# EasyEDA Pro project 电刺激_两块板_2026-10-19.epro, schematic Schematic1

## Sheets
1 主控: Assembly Variant: Basic; Board Name: Board1; Create Date: 2026-04-27; Page Name: P1; Project Name: 电刺激+主控; Schematic Name: Schematic1; Update Date: 2026-04-27; Company: 嘉立创EDA; Page Size: A4; Version: V1.0
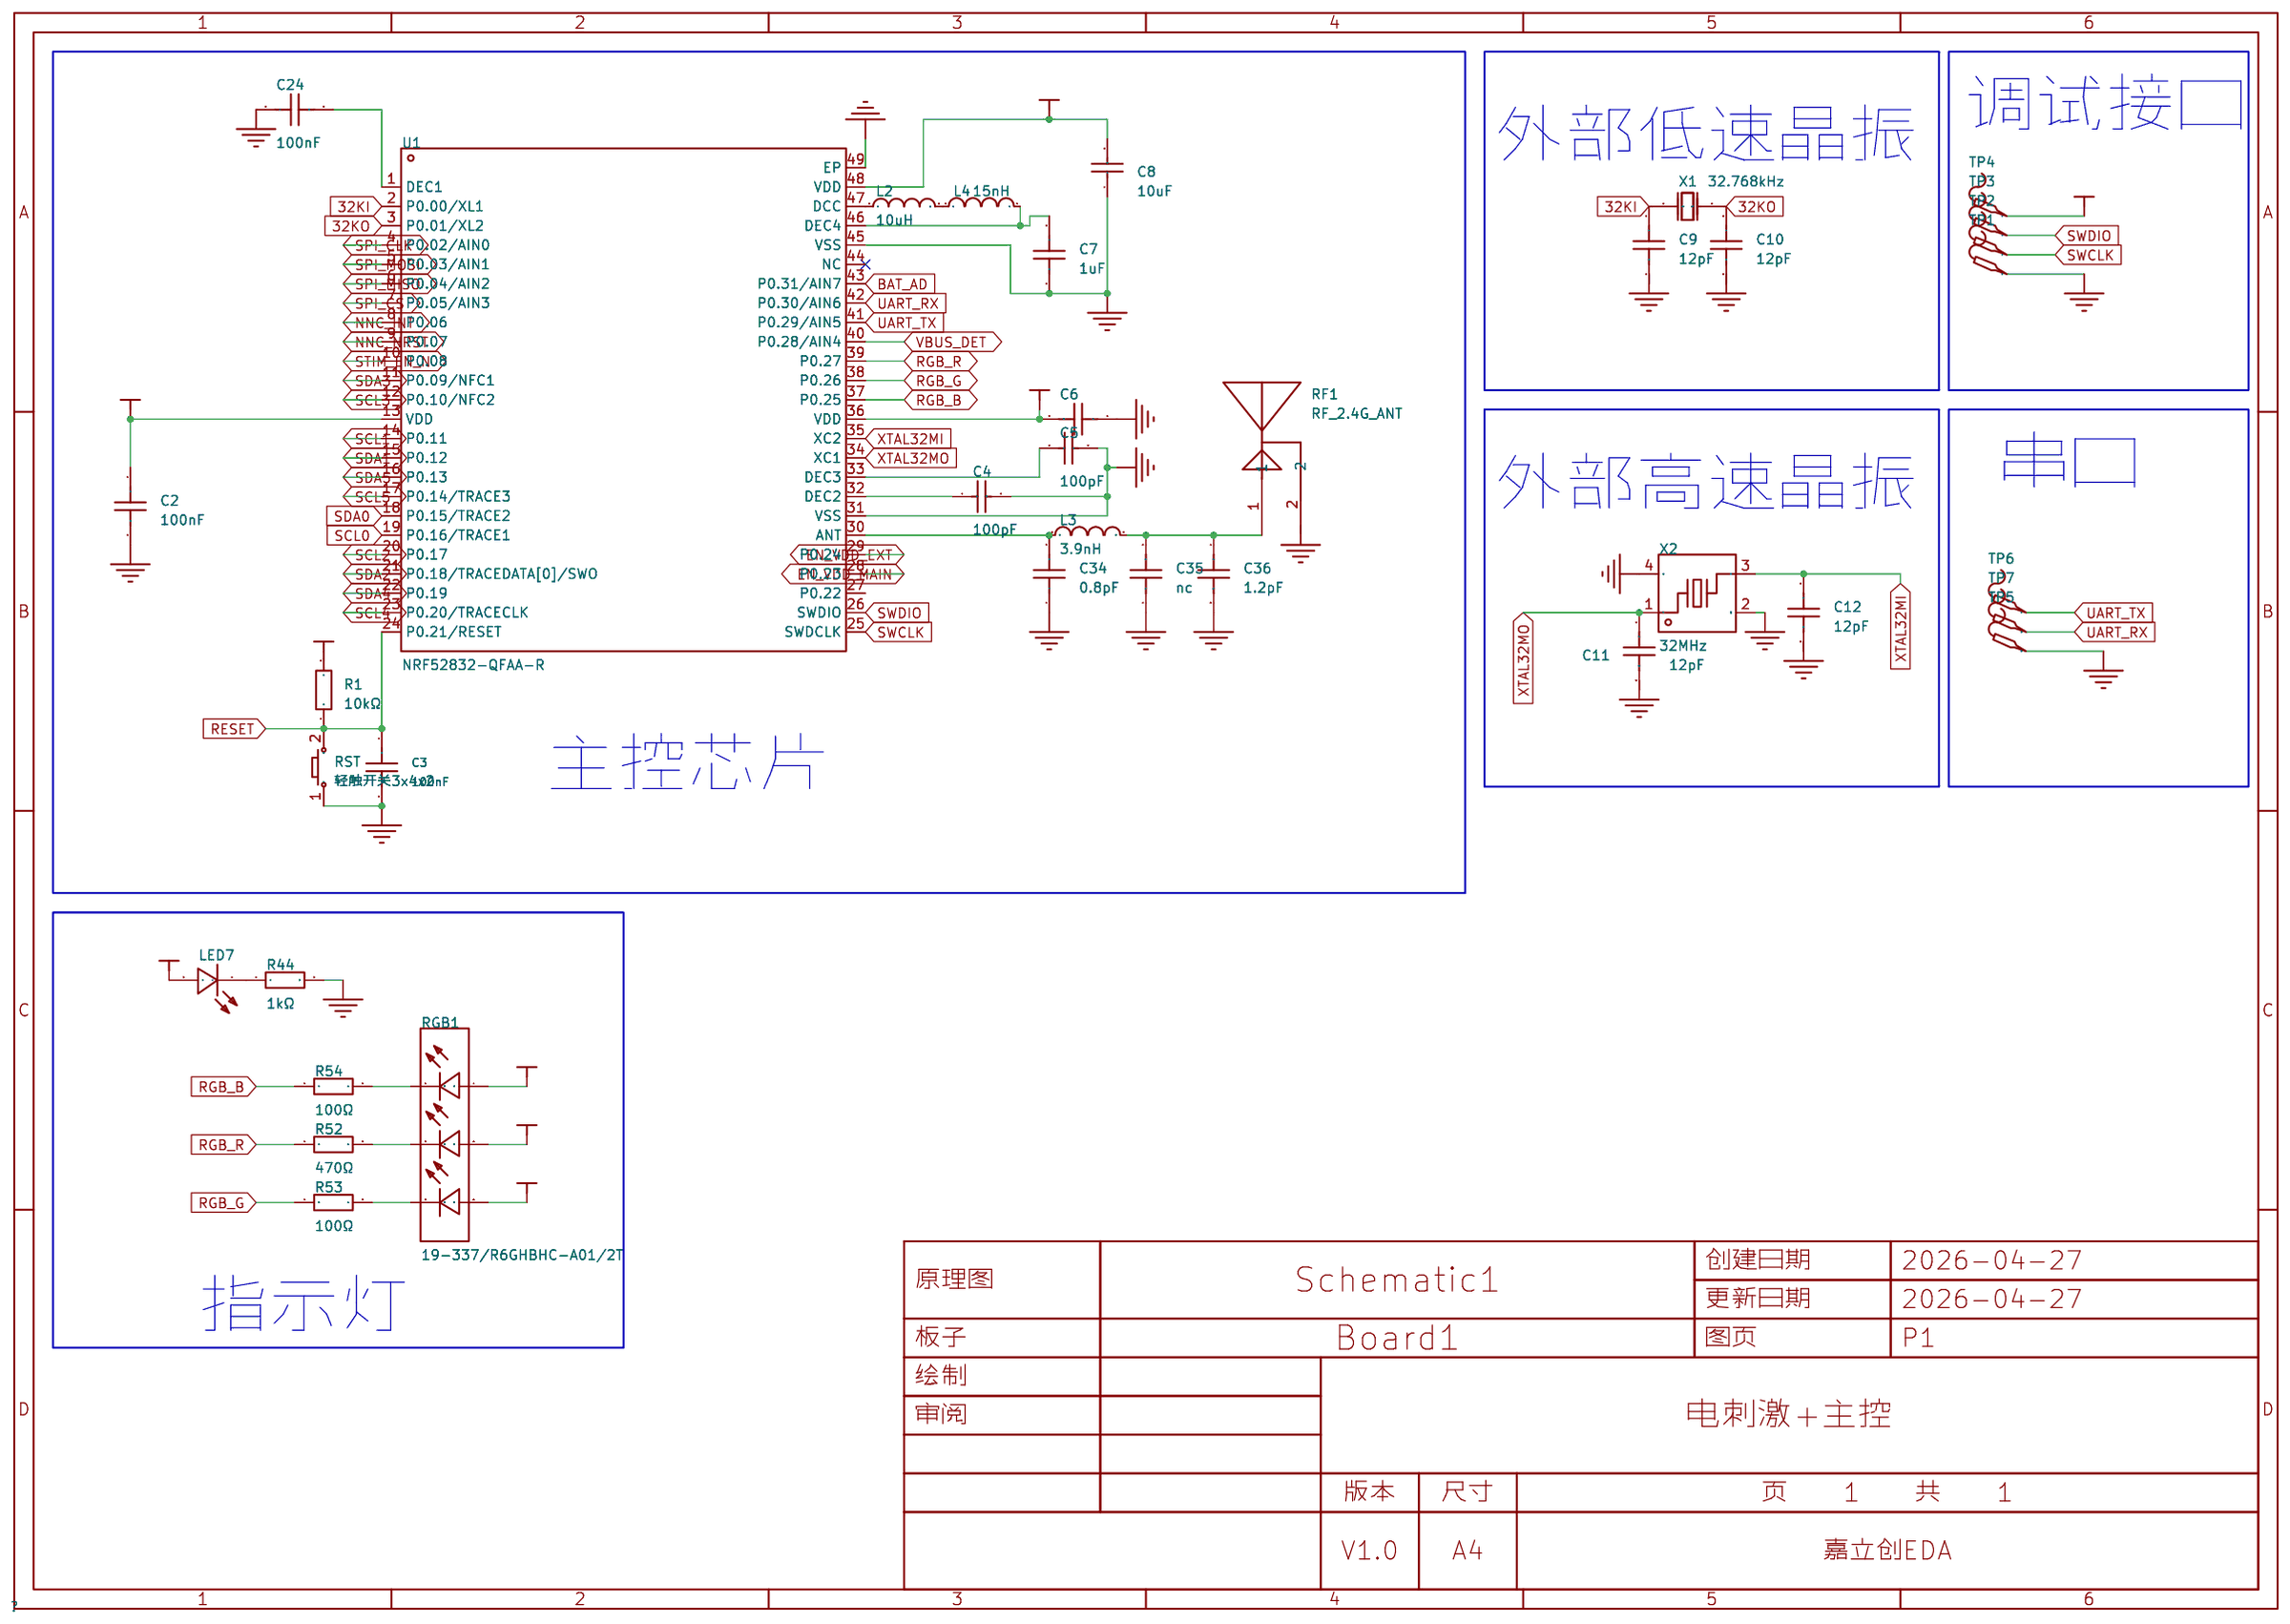
[diagram p2: 主控]
2 电源: Board Name: 主控板; Create Date: 2026-09-04; Project Name: 电刺激_两块板; Update Date: 2026-09-04
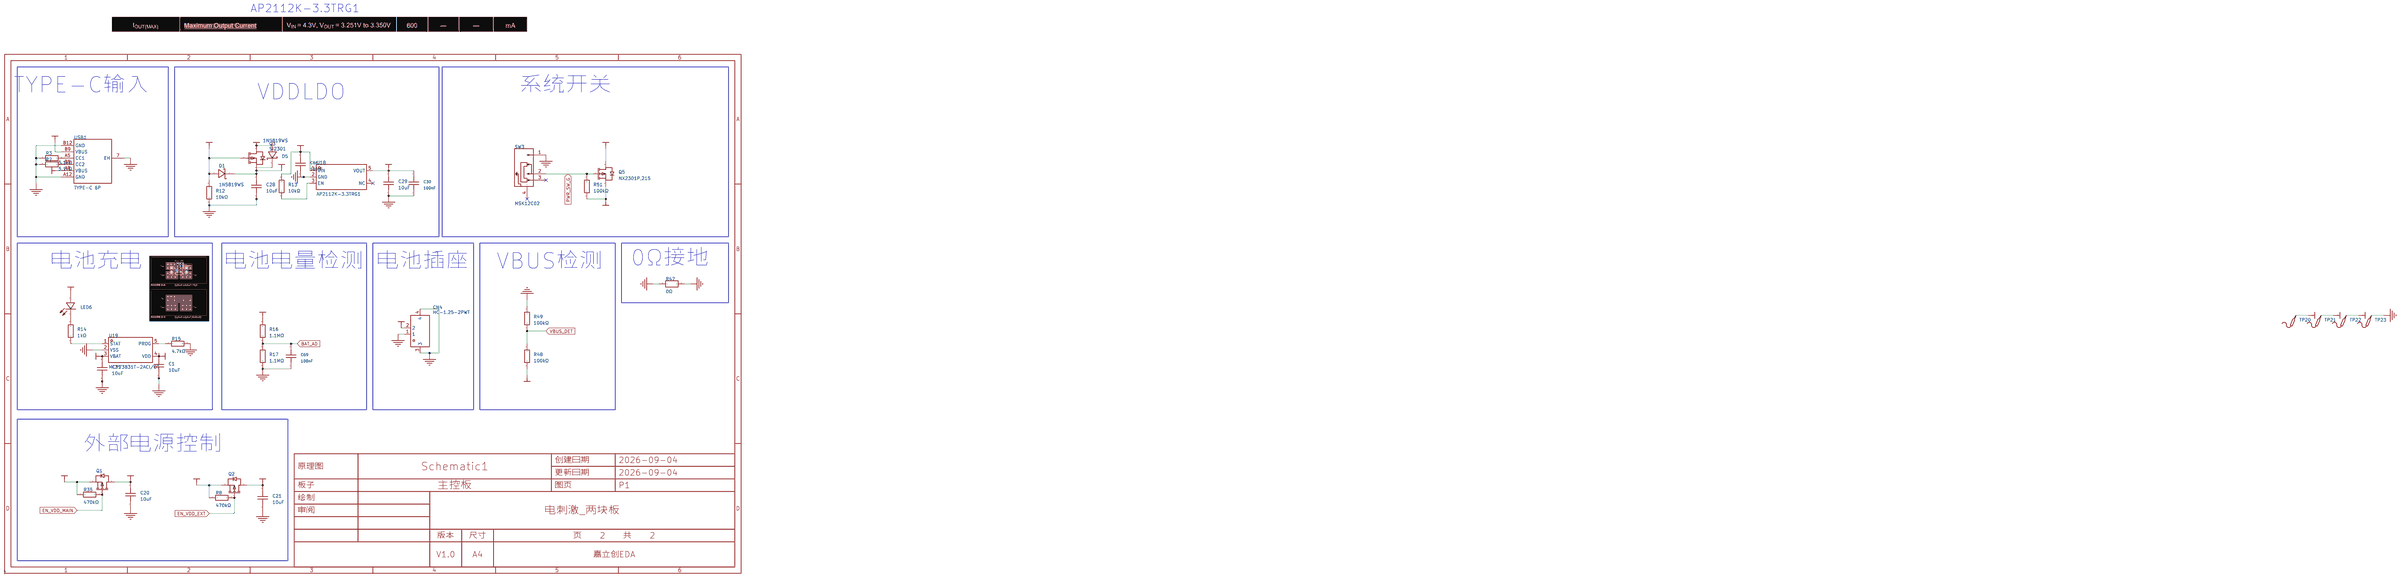
[diagram p3: 电源]
3 传感器与接口: Board Name: 主控板; Create Date: 2026-10-17; Project Name: 电刺激_两块板; Update Date: 2026-10-17
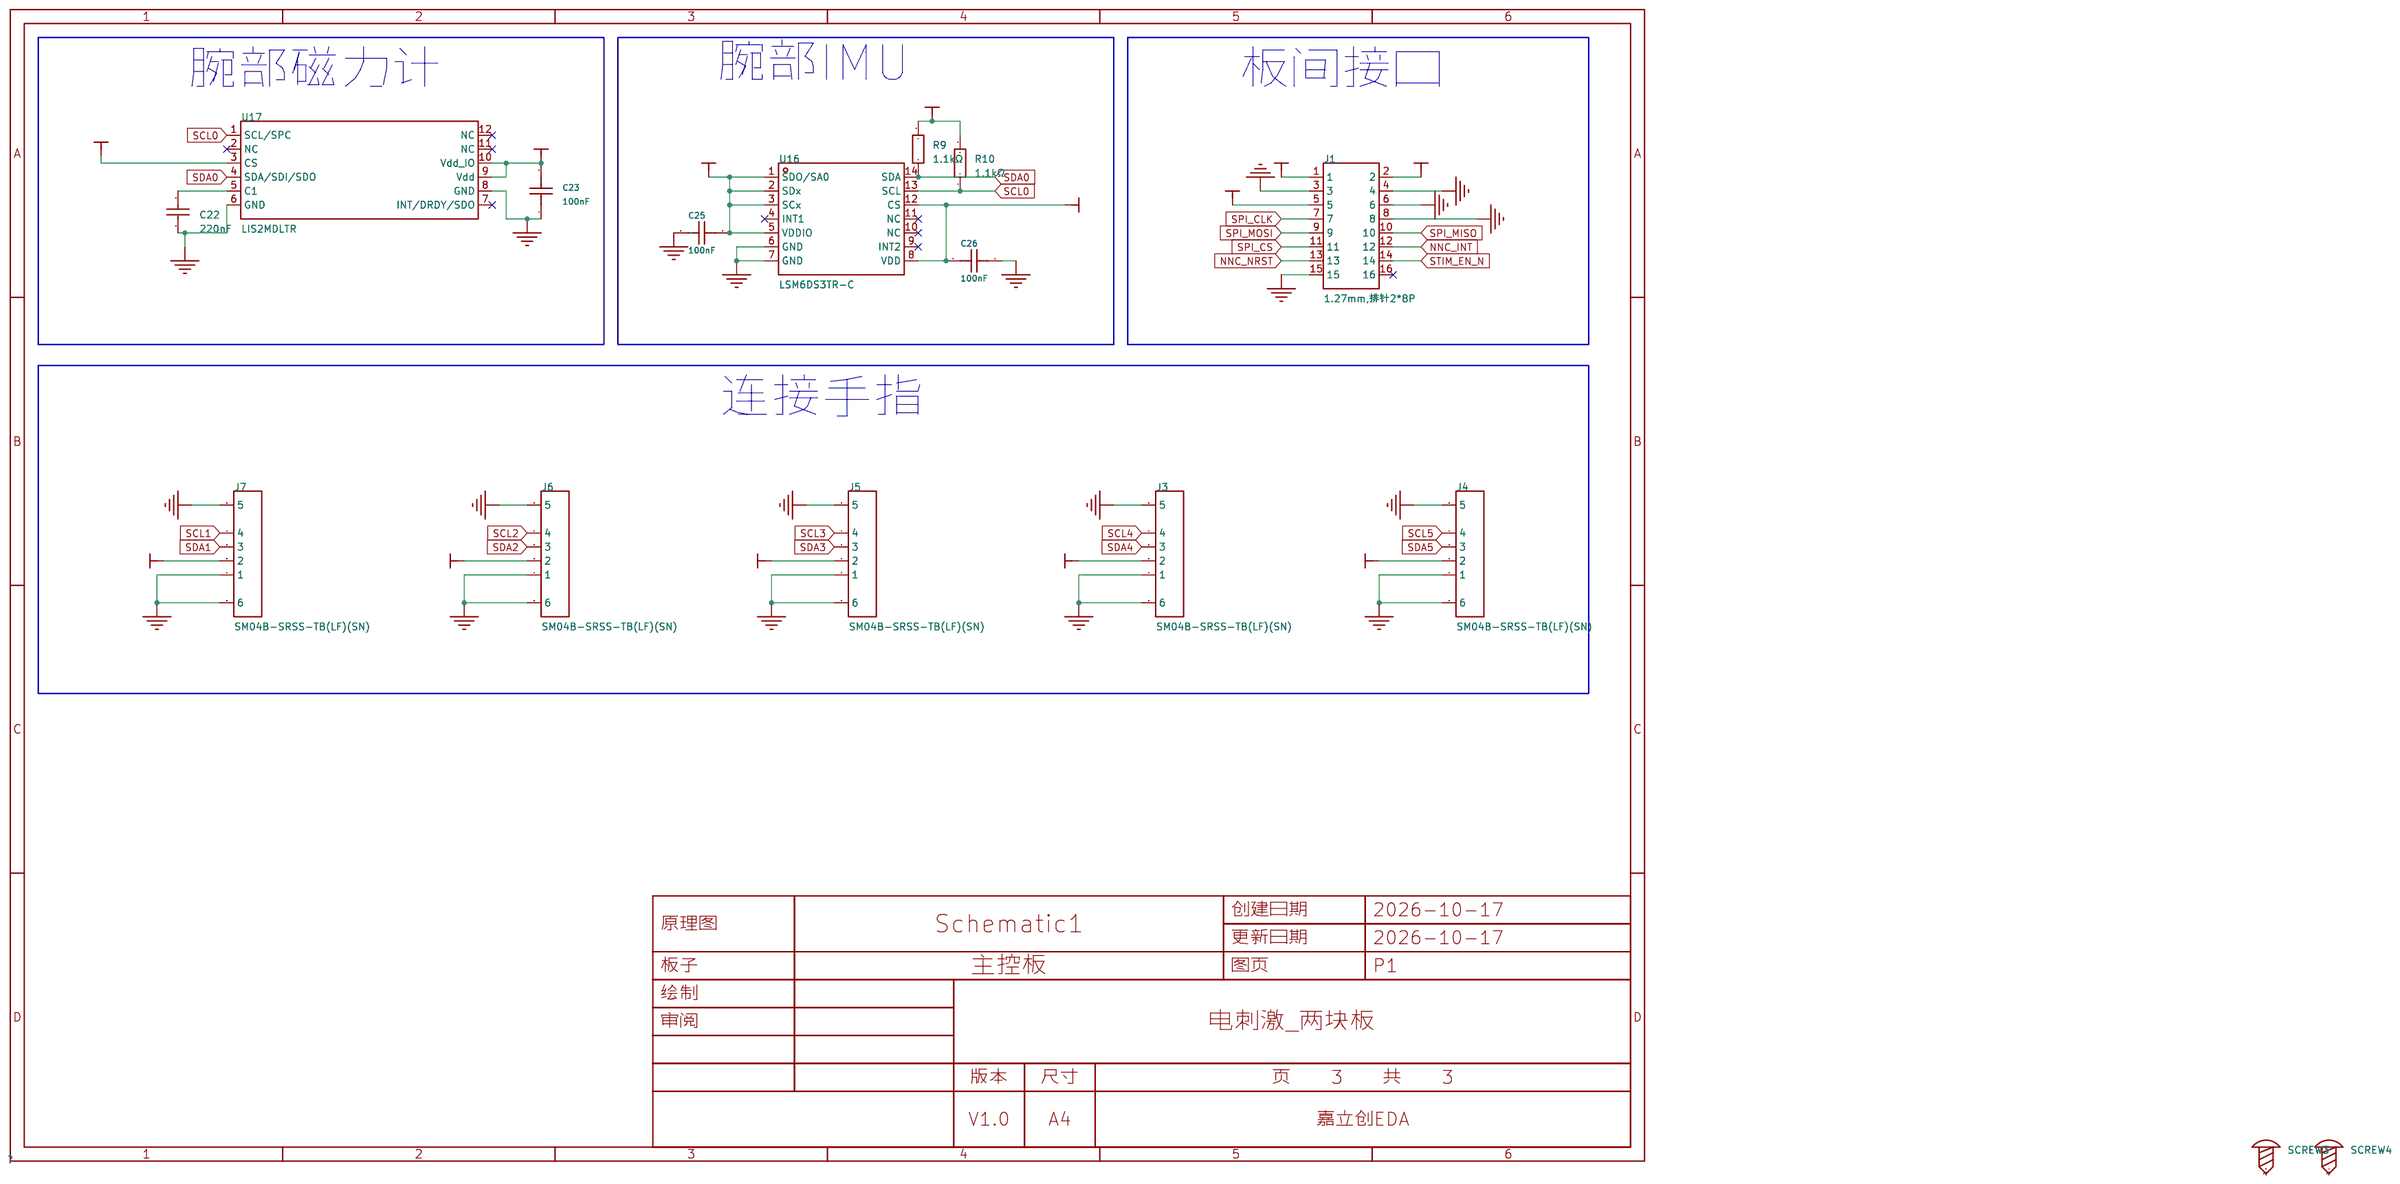
[diagram p4: 传感器与接口]

## Parts
sheet 主控
C2  100nF  [C0402]
C3  100nF  [C0603]
C4  100pF  [C0402]  (no BOM)
C5  100pF  [C0402]
C6  100nF  [C0402]
C7  1uF  [C0402]
C8  10uF  [C0402]
C9  12pF  [C0402]
C10  12pF  [C0402]
C11  12pF  [C0402]
C12  12pF  [C0402]
C24  100nF  [C0402]
C34  0.8pF  [C0402]
C35  nc  [C0402]  (no BOM)
C36  1.2pF  [C0402]
L2  10uH  [IND-SMD_L1.0-W0.5-2]
L3  3.9nH  [L0402]
L4  15nH  [IND-SMD_L1.0-W0.5-2]
LED7  NCD0402R1  [LED-SMD_L1.0-W0.5_FC-F1005UGK]
R1  10kΩ  [R0603]
R44  1kΩ  [R0603]
R52  470Ω  [R0603]
R53  100Ω  [R0603]
R54  100Ω  [R0603]
RF1  RF_2.4G_ANT  [天线封装]  (no BOM)
RGB1  19-337/R6GHBHC-A01/2T  [LED-ARRAY-SMD_6P-L1.6-W1.6-TL]
RST  轻触开关3x4x2  [Key_SMD_3x4x2]
TP1  -  [Test-Point-0.5mm]  (no BOM)
TP2  -  [Test-Point-0.5mm]  (no BOM)
TP3  -  [Test-Point-0.5mm]  (no BOM)
TP4  -  [Test-Point-0.5mm]  (no BOM)
TP5  -  [Test-Point-0.5mm]  (no BOM)
TP6  -  [Test-Point-0.5mm]  (no BOM)
TP7  -  [Test-Point-0.5mm]  (no BOM)
U1  NRF52832-QFAA-R  [QFN-48_L6.0-W6.0-P0.40-BL-EP3.8]
X1  32.768kHz  [OSC-SMD_2P-L3.2-W1.5]
X2  32MHz  [CRYSTAL-SMD_4P-L2.5-W2.0-BL]
sheet 传感器与接口
C22  220nF  [C0603]
C23  100nF  [C0603]
C25  100nF  [C0603]
C26  100nF  [C0603]
J1  1.27mm,排针2*8P  [HDR-SMD_16P-P1.27-V-M-R2-C8-LS5.3]
J3  SM04B-SRSS-TB(LF)(SN)  [CONN-SMD_4P-P1.00_SM04B-SRSS-TB-LF-SN]
J4  SM04B-SRSS-TB(LF)(SN)  [CONN-SMD_4P-P1.00_SM04B-SRSS-TB-LF-SN]
J5  SM04B-SRSS-TB(LF)(SN)  [CONN-SMD_4P-P1.00_SM04B-SRSS-TB-LF-SN]
J6  SM04B-SRSS-TB(LF)(SN)  [CONN-SMD_4P-P1.00_SM04B-SRSS-TB-LF-SN]
J7  SM04B-SRSS-TB(LF)(SN)  [CONN-SMD_4P-P1.00_SM04B-SRSS-TB-LF-SN]
R9  1.1kΩ  [R0603]
R10  1.1kΩ  [R0603]
SCREW3  -  [M2螺丝]  (no BOM)
SCREW4  -  [M2螺丝]  (no BOM)
U16  LSM6DS3TR-C  [LGA-14_L3.0-W2.5-P0.50-TL]
U17  LIS2MDLTR  [VLGA-12_L2.0-W2.0-P0.50-BL]
sheet 电源
C1  10uF  [C0603]
C20  10uF  [C0603]
C21  10uF  [C0603]
C28  10uF  [C0603]
C29  10uF  [C0603]
C30  100nF  [C0603]
C31  10uF  [C0603]
C66  100nF  [C0603]
C69  100nF  [C0603]
CN4  HC-1.25-2PWT  [CONN-SMD_2P-P1.25-HC-1.25-2PWT]
D1  1N5819WS  [SOD-323_L1.8-W1.3-LS2.5-RD]
D5  1N5819WS  [SOD-323_L1.8-W1.3-LS2.5-RD]
LED6  NCD0402R1  [LED-SMD_L1.0-W0.5_FC-F1005UGK]
Q1  NX2301P,215  [SOT-23-3_L2.9-W1.3-P1.90-LS2.4-BR]
Q2  NX2301P,215  [SOT-23-3_L2.9-W1.3-P1.90-LS2.4-BR]
Q3  SI2301  [SOT-23-3_L2.9-W1.3-P1.90-LS2.4-BR]
Q5  NX2301P,215  [SOT-23-3_L2.9-W1.3-P1.90-LS2.4-BR]
R2  5.1kΩ  [R0603]
R3  5.1kΩ  [R0603]
R8  470kΩ  [R0603]
R12  10kΩ  [R0603]
R13  10kΩ  [R0603]
R14  1kΩ  [R0603]
R15  4.7kΩ  [R0603]
R16  1.1MΩ  [R0603]
R17  1.1MΩ  [R0603]
R35  470kΩ  [R0603]
R47  0Ω  [R0805]
R48  100kΩ  [R0603]
R49  100kΩ  [R0603]
R51  100kΩ  [R0603]
SW3  MSK12C02  [SW-TH_MSK12C02]
TP20  -  [Test-Point-0.5mm]  (no BOM)
TP21  -  [Test-Point-0.5mm]  (no BOM)
TP22  -  [Test-Point-0.5mm]  (no BOM)
TP23  -  [Test-Point-0.5mm]  (no BOM)
U18  AP2112K-3.3TRG1  [SOT-25-5_L2.9-W1.6-P0.95-LS2.8-BL]
U19  MCP73831T-2ACI/OT  [SOT-23-5_L3.0-W1.7-P0.95-LS2.8-BL]
USB1  TYPE-C 6P  [TYPE-C-SMD_TYPE-C-6P_1]

## Library data of the parts
C2 C6 C24 = CL05B104KB54PNC: 容值:100nF;精度:±10%;额定电压:50V;温度系数:X7R;; LCSC Part Name: 100nF ±10% 50V; Supplier Part: C307331; Manufacturer: SAMSUNG(三星); Supplier Footprint: 0402; JLCPCB Part Class: Basic Part; Datasheet: https://item.szlcsc.com/datasheet/CL05B104KB54PNC/291005.html; Supplier: LCSC; Tolerance: ±10%; Voltage Rating: 50V; Temperature Coefficient: X7R
C3 C23 C25 C26 C30 C66 C69 = CC0603KRX7R9BB104: 容值:100nF;精度:±10%;额定电压:50V;温度系数:X7R;; LCSC Part Name: 100nF ±10% 50V; Supplier Part: C14663; Manufacturer: YAGEO(国巨); Supplier Footprint: 0603; JLCPCB Part Class: Basic Part; Datasheet: https://item.szlcsc.com/datasheet/CC0603KRX7R9BB104/15331.html; Supplier: LCSC; Tolerance: ±10%; Voltage Rating: 50V; Temperature Coefficient: X7R
C4 C5 = CL05C101JB5NNNC: 容值:100pF;精度:±5%;额定电压:50V;温度系数:C0G;; LCSC Part Name: 100pF ±5% 50V; Supplier Part: C26409; Manufacturer: SAMSUNG(三星); Supplier Footprint: 0402; JLCPCB Part Class: Extended Part; Datasheet: https://item.szlcsc.com/datasheet/CL05C101JB5NNNC/27153.html; Supplier: LCSC; Tolerance: ±5%; Voltage Rating: 50V; Temperature Coefficient: C0G
C7 = CL05A105KA5NQNC: 容值:1uF;精度:±10%;额定电压:25V;温度系数:X5R;; LCSC Part Name: 1uF ±10% 25V; Supplier Part: C52923; Manufacturer: SAMSUNG(三星); Supplier Footprint: 0402; JLCPCB Part Class: Basic Part; Datasheet: https://item.szlcsc.com/datasheet/CL05A105KA5NQNC/53938.html; Supplier: LCSC; Tolerance: ±10%; Voltage Rating: 25V; Temperature Coefficient: X5R
C8 = CL05A106MQ5NUNC: 容值:10uF;精度:±20%;额定电压:6.3V;温度系数:X5R;; LCSC Part Name: 10uF ±20% 6.3V; Supplier Part: C15525; Manufacturer: SAMSUNG(三星); Supplier Footprint: 0402; JLCPCB Part Class: Basic Part; Datasheet: https://item.szlcsc.com/datasheet/CL05A106MQ5NUNC/16204.html; Supplier: LCSC; Tolerance: ±20%; Voltage Rating: 6.3V; Temperature Coefficient: X5R
C9-C12 = 0402CG120F500NT: 容值:12pF;精度:±1%;额定电压:50V;温度系数:C0G;; LCSC Part Name: 12pF ±1% 50V; Supplier Part: C182477; Manufacturer: FH(风华); Supplier Footprint: 0402; JLCPCB Part Class: Extended Part; Datasheet: https://item.szlcsc.com/datasheet/0402CG120F500NT/193878.html; Supplier: LCSC; Tolerance: ±1%; Voltage Rating: 50V; Temperature Coefficient: C0G
C34 C35 = GJM1555C1HR80WB01D: 容值:0.8pF;额定电压:50V;温度系数:C0G;; LCSC Part Name: ±0.05pF 0.8pF 50V; Supplier Part: C88902; Manufacturer: muRata(村田); Supplier Footprint: 0402; JLCPCB Part Class: Extended Part; Datasheet: https://atta.szlcsc.com/upload/public/pdf/source/20241220/D0AFAF126C1929700C0BCD7972400352.pdf; Supplier: LCSC; Voltage Rating: 50V; Temperature Coefficient: C0G
C36 = CL05C1R2BB5NNNC: 容值:1.2pF;额定电压:50V;温度系数:C0G;; LCSC Part Name: ±0.1pF 1.2pF 50V; Supplier Part: C159809; Manufacturer: SAMSUNG(三星); Supplier Footprint: 0402; JLCPCB Part Class: Extended Part; Datasheet: https://item.szlcsc.com/datasheet/CL05C1R2BB5NNNC/171189.html; Supplier: LCSC; Voltage Rating: 50V; Temperature Coefficient: C0G
L2 = LQW15DN100M00D: 电感值:10uH;精度:±20%;额定电流:120mA;饱和电流(Isat):120mA;类型:-;; LCSC Part Name: 10uH ±20% 120mA; Supplier Part: C910650; Manufacturer: muRata(村田); Supplier Footprint: 0402; JLCPCB Part Class: Extended Part; Datasheet: https://atta.szlcsc.com/upload/public/pdf/source/20230630/1FD8E6B315B46B322CAEAF0711532ED5.pdf; Supplier: LCSC; Tolerance: ±20%; Rated Current: 120mA; Saturation Current (Isat): 120mA; DC Resistance (DCR): 5.405Ω
L3 = SDCL1005C3N9STDF: 电感值:3.9nH;精度:-;额定电流:300mA;饱和电流(Isat):-;直流电阻(DCR):200mΩ;; LCSC Part Name: ±0.3nH 3.9nH; Supplier Part: C14033; Manufacturer: Sunlord(顺络); Supplier Footprint: 0402; JLCPCB Part Class: Extended Part; Datasheet: https://item.szlcsc.com/datasheet/SDCL1005C3N9STDF/14690.html; Supplier: LCSC; Current Rating: 300mA; DC Resistance(DCR): 200mΩ; Q @ Frequency: 8@100MHz; Frequency - Self Resonant: 4GHz
L4 = LQW15AN15NG00D: 电感值:15nH;精度:±2%;额定电流:460mA;饱和电流(Isat):-;类型:非屏蔽电感;; LCSC Part Name: 15nH ±2%; Supplier Part: C98055; Manufacturer: muRata(村田); Supplier Footprint: 0402; JLCPCB Part Class: Extended Part; Datasheet: https://item.szlcsc.com/datasheet/LQW15AN15NG00D/99264.html; Supplier: LCSC; Tolerance: ±2%; Current Rating: 460mA; DC Resistance(DCR): 160mΩ; Type: 非屏蔽电感
LED6 LED7 = NCD0402R1: 灯头类型:-;发光颜色:红色;正向压降(Vf):1.6V~2.6V;功率:65mW;正向电流:25mA;波长:615nm~635nm;二极管配置:独立二极管;透镜颜色:-;色温:-;发光强度:30mcd;发光角度:130°;载带方式:-;工作温度:-30℃~+85℃;; LCSC Part Name: 片式发光二极管; Supplier Part: C130719; Manufacturer: 国星光电; Supplier Footprint: 0402; JLCPCB Part Class: Extended Part; Datasheet: https://item.szlcsc.com/datasheet/NCD0402R1/142008.html; Supplier: LCSC; Illumination Color: 红色; Voltage - Forward(Vf): 1.6V~2.6V; Power(Watts): 65mW; Forward Current: 25mA; Wavelength - Dominant: 615nm~635nm; Peak Wavelength: 630nm; Diode Configuration: 独立二极管; Luminous Intensity: 30mcd; Viewing Angle: 130°; Operating Temperature: -30℃~+85℃
R1 R12 R13 = 0603WAF1002T5E: 电阻类型:厚膜电阻;阻值:10kΩ;精度:±1%;功率:100mW;工作电压:75V;温度系数:±100ppm/℃;; LCSC Part Name: 厚膜电阻 10kΩ ±1% 100mW; Supplier Part: C25804; Manufacturer: UNI-ROYAL(厚声); Supplier Footprint: 0603; JLCPCB Part Class: Basic Part; Datasheet: https://item.szlcsc.com/datasheet/0603WAF1002T5E/26547.html; Supplier: LCSC; Type: 厚膜电阻; Tolerance: ±1%; Power(Watts): 100mW; Voltage-Supply(Max): 75V; Temperature Coefficient: ±100ppm/℃; Operating Temperature: -55℃~+155℃
R14 R44 = 0603WAF1001T5E: 电阻类型:厚膜电阻;阻值:1kΩ;精度:±1%;功率:100mW;工作电压:75V;温度系数:±100ppm/℃;; LCSC Part Name: 1kΩ ±1% 100mW 厚膜电阻; Supplier Part: C21190; Manufacturer: UNI-ROYAL(厚声); Supplier Footprint: 0603; JLCPCB Part Class: Basic Part; Datasheet: https://item.szlcsc.com/datasheet/0603WAF1001T5E/21904.html; Supplier: LCSC; Type: 厚膜电阻; Tolerance: ±1%; Power(Watts): 100mW; Voltage-Supply(Max): 75V; Temperature Coefficient: ±100ppm/℃; Operating Temperature: -55℃~+155℃
R52 = 0603WAF4700T5E: 电阻类型:厚膜电阻;阻值:470Ω;精度:±1%;功率:100mW;工作电压:75V;温度系数:±100ppm/℃;; LCSC Part Name: 厚膜电阻 470Ω ±1%; Supplier Part: C23179; Manufacturer: UNI-ROYAL(厚声); Supplier Footprint: 0603; JLCPCB Part Class: Basic Part; Datasheet: https://item.szlcsc.com/datasheet/0603WAF4700T5E/23906.html; Supplier: LCSC; Type: 厚膜电阻; Tolerance: ±1%; Power(Watts): 100mW; Voltage-Supply(Max): 75V; Temperature Coefficient: ±100ppm/℃; Operating Temperature: -55℃~+155℃
R53 R54 = 0603WAF1000T5E: 电阻类型:厚膜电阻;阻值:100Ω;精度:±1%;功率:100mW;最大工作电压:75V;温度系数:±200ppm/℃;; LCSC Part Name: 100Ω ±1% 100mW 厚膜电阻; Supplier Part: C22775; Manufacturer: UNI-ROYAL(厚声); Supplier Footprint: 0603; JLCPCB Part Class: Basic Part; Datasheet: https://atta.szlcsc.com/upload/public/pdf/source/20200306/C422600_1E6D84923E4A46A82E41ADD87F860B5C.pdf; Supplier: LCSC; Type: 厚膜电阻; Tolerance: ±1%; Power(Watts): 100mW; Overload Voltage (Max): 75V; Temperature Coefficient: ±200ppm/℃; Operating Temperature Range: -55℃~+155℃
RF1 = RF_2.4G_ANT: Supplier Part: RF_2.4G_ANT.1
RGB1 = 19-337/R6GHBHC-A01/2T: LCSC Part Name: RGB三色; Supplier Part: C264519; Manufacturer: EVERLIGHT(亿光); Supplier Footprint: SMD-6P,1.6x1.6mm; JLCPCB Part Class: Extended Part; Datasheet: https://en.everlight.com/wp-content/plugins/ItemRelationship/product_files/pdf/19-337-R6GHBHC-A01-2T.pdf; Supplier: LCSC; Diode Configuration: 独立式; Dominant Wavelength - R: 624nm; Dominant Wavelength - G: 525nm; Dominant Wavelength - B: 470nm; Viewing Angle: 120°; Antistatic Capacity: R:2000V；B:150V；G:150V; Peak Wavelength - R: 632nm; Peak Wavelength - G: 518nm; Peak Wavelength - B: 468nm; Installation Method: 正贴; Operating Temperature: -40℃~+85℃; Length: 1.6mm; Width: 1.6mm; Height: 0.35mm; Luminous Intensity - R: 100mcd; Luminous Intensity - G: 180mcd; Luminous Intensity - B: 50mcd; Forward Voltage(Vf) - R: 1.7V~2.4V; Forward Voltage(Vf) - G: 2.7V~3.8V; Forward Voltage(Vf) - B: 2.7V~3.8V; Forward Current - R: 25mA; Forward Current - G: 25mA; Forward Current - B: 25mA; Power(Watts) - R: 60mW; Power(Watts) - G: 95mW; Power(Watts) - B: 95mW
RST = Key_SMD_3x4x2: Supplier Footprint: SMD; Manufacturer: 国产; Supplier: LCSC; Supplier Part: C26638; LCSC Part Name: 4*3*2mm 立贴 轻触开关; JLCPCB Part Class: Extended Part; Datasheet: https://atta.szlcsc.com/upload/public/pdf/source/20150923/1457707412058.pdf; Circuit: 单刀单掷; Actuator Style: 圆形按钮; Mounting Style: 立贴; Switch Length: 4mm; Switch Width: 3mm; Switch Height: 2mm; Contact Current: 50mA; Voltage Rating (DC): 12V
TP1-TP7 TP20-TP23 = Test-Point: Test Point 测试点; Supplier Part: Test-Point.1
U1 = NRF52832-QFAA-R: 频率范围:-;接口类型:I2C；UART；SPI;应用领域:IoT；蓝牙;数据速率:2Mbps;灵敏度:-96dBm;典型应用频率:2.4GHz;; LCSC Part Name: 2.4 GHz收发器，蓝牙低功耗模式; Supplier Part: C77540; Manufacturer: NORDIC; Supplier Footprint: QFN-48-EP(6x6); JLCPCB Part Class: Extended Part; Datasheet: https://item.szlcsc.com/datasheet/NRF52832-QFAA-R/78669.html; Supplier: LCSC; Interface: I2C；UART；SPI; Voltage - Supply: 1.7V~3.6V; Applications: IoT；蓝牙; Output Power: 4dBm; Data Rate: 2Mbps; Current Of Transmitting: 5.3mA; Sensitivity: -96dBm; Receive Current: 5.4mA; Typical Application Frequency: 2.4GHz; Operating Temperature: -40℃~+85℃; Type: 收发器
X1 = CM315D32768DZFT: 晶振类型:-;频率:32.768kHz;常温频差:±20ppm;外接负载电容:12.5pF;; LCSC Part Name: 32.768kHz ±20ppm 12.5pF; Supplier Part: C182057; Manufacturer: CITIZEN; Supplier Footprint: SMD3215-2P; JLCPCB Part Class: Extended Part; Datasheet: https://atta.szlcsc.com/upload/public/pdf/source/20180224/C182057_15194369676281363999.pdf; Supplier: LCSC; Normal temperature Frequency Tolerance: ±20ppm; External load capacitor: 12.5pF; Equivalent Series Resistance (ESR): 70kΩ; Operating Temperature: -40℃~+85℃
X2 = S2232000121040: 晶振类型:贴片晶振;频率:32MHz;常温频差:±10ppm;负载电容:12pF;; LCSC Part Name: 32MHz ±10ppm 12pF; Supplier Part: C1508946; Manufacturer: JGHC(晶光华); Supplier Footprint: SMD2520-4P; JLCPCB Part Class: Extended Part; Datasheet: https://atta.szlcsc.com/upload/public/pdf/source/20200102/C479187_D94AAA14F8877AC0B7C204DEF1552113.pdf; Supplier: LCSC; Crystal Type: 贴片晶振; Normal temperature Frequency Tolerance: ±10ppm; Load Capacitor: 12pF; Equivalent Series Resistance (ESR): 40Ω; Operating Temperature: -40℃~+85℃
C22 = CL10B224KB8NNNC: 容值:220nF;精度:±10%;额定电压:50V;温度系数:X7R;; LCSC Part Name: 220nF ±10% 50V; Supplier Part: C64705; Manufacturer: SAMSUNG(三星); Supplier Footprint: 0603; JLCPCB Part Class: Extended Part; Datasheet: https://item.szlcsc.com/datasheet/CL10B224KB8NNNC/65773.html; Supplier: LCSC; Tolerance: ±10%; Voltage Rating: 50V; Temperature Coefficient: X7R
J1 = 1.27mm,排针2*8P: Supplier Part: C2941238; Supplier Footprint: SMD; JLCPCB Part Class: Extended Part; Supplier: LCSC
J3-J7 = SM04B-SRSS-TB(LF)(SN): 插针结构:1x4P;间距:1mm;安装方式:卧贴;参考系列:SH;总PIN数:4P;排数:1;每排PIN数:4;行距:-;额定电流:1A;触头材质:铜合金;触头镀层:锡;工作温度:-25℃~+85℃;; LCSC Part Name: 1x4P 间距:1mm 卧贴 系列:SH; Supplier Part: C160404; Manufacturer: JST; Supplier Footprint: SMD,P=1mm,卧贴; JLCPCB Part Class: Extended Part; Datasheet: https://item.szlcsc.com/datasheet/SM04B-SRSS-TB(LF)(SN)/171784.html; Supplier: LCSC; Pins Structure: 1x4P; Pitch: 1mm; Mounting Type: 卧贴; Reference Series: SH; Number of Pins: 4P; Number of Rows: 1; Number of PINs Per Row: 4; Current Rating: 1A; Contact Material: 铜合金; Contact Plating: 锡; Operating Temperature: -25℃~+85℃; Voltage Rating: 50V; Plastic Material: PA; Flame Retardant Rating: UL94V-0; Supplementary Features: 辅助焊脚; Color: 白色; Z-Height of the Board: 2.9mm; X-Length of Bottom Edge on Board (Spacing Line): 6mm; Y-Width of Bottom Edge on Board: 4.32mm
R9 R10 = 0603WAF1101T5E: 电阻类型:厚膜电阻;阻值:1.1kΩ;精度:±1%;功率:100mW;工作电压:75V;温度系数:±100ppm/℃;; LCSC Part Name: 厚膜电阻 1.1kΩ ±1%; Supplier Part: C22764; Manufacturer: UNI-ROYAL(厚声); Supplier Footprint: 0603; JLCPCB Part Class: Extended Part; Datasheet: https://item.szlcsc.com/datasheet/0603WAF1101T5E/23491.html; Supplier: LCSC; Type: 厚膜电阻; Tolerance: ±1%; Power(Watts): 100mW; Voltage-Supply(Max): 75V; Temperature Coefficient: ±100ppm/℃; Operating Temperature: -55℃~+155℃
SCREW3 SCREW4 = M2螺丝: Supplier Footprint: 插件; Supplier Part: M3螺丝.1
U16 = LSM6DS3TR-C: 传感器类型:加速度计陀螺仪;接口类型:I2C；SPI;; LCSC Part Name: IMU-惯性测量单元; Supplier Part: C967633; Manufacturer: ST(意法半导体); Supplier Footprint: LGA-14(2.5x3); JLCPCB Part Class: Extended Part; Datasheet: https://item.szlcsc.com/datasheet/LSM6DS3TR-C/1054343.html; Supplier: LCSC; Accelerometer Sensing Axis: X,Y,Z; Acceleration Measurement Range (MAX): ±16g; Gyroscope Sensing Axis: X,Y,Z; Gyroscope Measurement Range (MAX): ±2000dps; Sensor Type: 加速度计陀螺仪; Interface: I2C；SPI; Voltage - Supply: 1.71V~3.6V; Cache Size: 4KB; Operating Temperature: -40℃~+85℃
U17 = LIS2MDLTR: 磁传感器、数字输出、50高斯磁场动态范围、超低功耗、高性能、3轴磁力计; LCSC Part Name: 霍尔效应开关; Supplier Part: C919695; Manufacturer: ST(意法半导体); Supplier Footprint: LGA-12(2x2); JLCPCB Part Class: Extended Part; Datasheet: https://item.szlcsc.com/datasheet/LIS2MDLTR/998419.html; Supplier: LCSC; Magnetic Sensing Range(X,Y): ±5mT; Magnetic Sensing Range(Z): ±5mT; Output bit: 16bit; Interface Type: SPI；I2C; Voltage - Supply: 1.71V~3.6V; Current - Supply: 200uA; Operating Temperature: -40℃~+85℃
C1 C20 C21 C28 C29 C31 = CL10A106KP8NNNC: 容值:10uF;精度:±10%;额定电压:10V;温度系数:X5R;; LCSC Part Name: 10uF ±10% 10V; Supplier Part: C19702; Manufacturer: SAMSUNG(三星); Supplier Footprint: 0603; JLCPCB Part Class: Basic Part; Datasheet: https://item.szlcsc.com/datasheet/CL10A106KP8NNNC/20411.html; Supplier: LCSC; Tolerance: ±10%; Voltage Rating: 10V; Temperature Coefficient: X5R
CN4 = HC-1.25-2PWT: 插针结构:1x2P;间距:1.25mm;安装方式:卧贴;参考系列:PicoBlade(MX 1.25);总PIN数:2P;排数:1;每排PIN数:2;行距:-;额定电流:1A;触头材质:黄铜;触头镀层:锡;工作温度:-40℃~+105℃;; LCSC Part Name: 1x2P 间距:1.25mm 卧贴 系列:PicoBlade(MX 1.25); Supplier Part: C2845379; Manufacturer: HCTL(华灿天禄); Supplier Footprint: SMD,P=1.25mm,卧贴; JLCPCB Part Class: Extended Part; Datasheet: https://item.szlcsc.com/datasheet/HC-1.25-2PWT/3039060.html; Supplier: LCSC; Pins Structure: 1x2P; Pitch: 1.25mm; Mounting Type: 卧贴; Reference Series: PicoBlade(MX 1.25); Number of Pins: 2P; Number of Rows: 1; Number of PINs Per Row: 2; Current Rating: 1A; Contact Material: 黄铜; Contact Plating: 锡; Operating Temperature: -40℃~+105℃; Voltage Rating: 125V; Plastic Material: LCP; Flame Retardant Rating: UL94V-0; Supplementary Features: 辅助焊脚; Z-Height of the Board: 3.57mm; X-Length of Bottom Edge on Board (Spacing Line): 7.55mm; Y-Width of Bottom Edge on Board: 5.25mm
D1 D5 = 1N5819WS_C191023: 正向压降(Vf):600mV@1A;直流反向耐压(Vr):40V;整流电流:1A;; LCSC Part Name: 电压:40V 电流:1A; Supplier Part: C191023; Manufacturer: Hottech(合科泰); Supplier Footprint: SOD-323; JLCPCB Part Class: Basic Part; Datasheet: https://item.szlcsc.com/datasheet/1N5819WS/213850.html; Supplier: LCSC; Voltage - Forward(Vf@If): 600mV@1A; Voltage - DC Reverse(Vr): 40V; Current - Rectified: 1A; Non-Repetitive Peak Forward Surge Current: 25A
Q1 Q2 = NX2301P,215: 数量:1个P沟道;漏源电压(Vdss):20V;连续漏极电流(Id):2A;导通电阻(RDS(on)):120mΩ@4.5V;耗散功率(Pd):400mW;阈值电压(Vgs(th)):1.1V@250uA;; LCSC Part Name: 1个P沟道 耐压:20V 电流:2A; Supplier Part: C191273; Manufacturer: Nexperia(安世); Supplier Footprint: SOT-23; JLCPCB Part Class: Extended Part; Datasheet: https://item.szlcsc.com/datasheet/NX2301P%252C215/214510.html; Supplier: LCSC; Number: 1个P沟道; Drain to Source Voltage: 20V; Current - Continuous Drain(Id): 2A; RDS(on): 120mΩ@4.5V; Pd - Power Dissipation: 400mW; Gate Threshold Voltage (Vgs(th)): 1.1V@250uA; Gate Charge(Qg): 6nC@4.5V; Input Capacitance(Ciss): 380pF; Reverse Transfer Capacitance (Crss@Vds): 115pF; Operating Temperature: -55℃~+150℃; Type: P沟道
Q3 = SI2301_C2891731: 数量:1个P沟道;漏源电压(Vdss):20V;连续漏极电流(Id):2.2A;导通电阻(RDS(on)):120mΩ@4.5V;耗散功率(Pd):700mW;阈值电压(Vgs(th)):1.5V@250uA;; LCSC Part Name: 1个P沟道 耐压:20V 电流:2.2A; Supplier Part: C2891731; Manufacturer: YONGYUTAI(永裕泰); Supplier Footprint: SOT-23; JLCPCB Part Class: Extended Part; Datasheet: https://item.szlcsc.com/datasheet/SI2301/3119650.html; Supplier: LCSC; Number: 1个P沟道; Drain to Source Voltage: 20V; Current - Continuous Drain(Id): 2.2A; RDS(on): 120mΩ@4.5V; Pd - Power Dissipation: 700mW; Gate Threshold Voltage (Vgs(th)): 1.5V@250uA; Input Capacitance(Ciss): 200pF@10V; Operating Temperature: -55℃~+150℃; Type: P沟道; Output Capacitance(Coss): 80pF
Q5 = NX2301P,215: 数量:1个P沟道;漏源电压(Vdss):20V;连续漏极电流(Id):2A;导通电阻(RDS(on)):120mΩ@4.5V;耗散功率(Pd):400mW;阈值电压(Vgs(th)):1.1V;; LCSC Part Name: 1个P沟道 耐压:20V 电流:2A; Supplier Part: C191273; Manufacturer: Nexperia(安世); Supplier Footprint: SOT-23; JLCPCB Part Class: Extended Part; Datasheet: https://item.szlcsc.com/datasheet/NX2301P%252C215/214510.html; Supplier: LCSC; Number: 1个P沟道; Drain to Source Voltage: 20V; Current - Continuous Drain(Id): 2A; RDS(on): 120mΩ@4.5V; Pd - Power Dissipation: 400mW; Gate Threshold Voltage (Vgs(th)): 1.1V; Gate Charge(Qg): 6nC@4.5V; Input Capacitance(Ciss): 380pF; Reverse Transfer Capacitance (Crss@Vds): 115pF; Operating Temperature: -55℃~+150℃; Type: P沟道; Output Capacitance(Coss): 135pF; Vgs: ±8V
R2 R3 = 0603WAF5101T5E: 电阻类型:厚膜电阻;阻值:5.1kΩ;精度:±1%;功率:100mW;工作电压:75V;温度系数:±100ppm/℃;; LCSC Part Name: 厚膜电阻 5.1kΩ ±1%; Supplier Part: C23186; Manufacturer: UNI-ROYAL(厚声); Supplier Footprint: 0603; JLCPCB Part Class: Basic Part; Datasheet: https://item.szlcsc.com/datasheet/0603WAF5101T5E/23913.html; Supplier: LCSC; Type: 厚膜电阻; Tolerance: ±1%; Power(Watts): 100mW; Voltage-Supply(Max): 75V; Temperature Coefficient: ±100ppm/℃; Operating Temperature: -55℃~+155℃
R8 R35 = 0603WAF4703T5E: 电阻类型:厚膜电阻;阻值:470kΩ;精度:±1%;功率:100mW;工作电压:75V;温度系数:±100ppm/℃;; LCSC Part Name: 厚膜电阻 470kΩ ±1%; Supplier Part: C23178; Manufacturer: UNI-ROYAL(厚声); Supplier Footprint: 0603; JLCPCB Part Class: Basic Part; Datasheet: https://item.szlcsc.com/datasheet/0603WAF4703T5E/23905.html; Supplier: LCSC; Type: 厚膜电阻; Tolerance: ±1%; Power(Watts): 100mW; Voltage-Supply(Max): 75V; Temperature Coefficient: ±100ppm/℃; Operating Temperature: -55℃~+155℃
R15 = 0603WAF4701T5E: 电阻类型:厚膜电阻;阻值:4.7kΩ;精度:±1%;功率:100mW;工作电压:75V;温度系数:±100ppm/℃;; LCSC Part Name: 厚膜电阻 4.7kΩ ±1%; Supplier Part: C23162; Manufacturer: UNI-ROYAL(厚声); Supplier Footprint: 0603; JLCPCB Part Class: Basic Part; Datasheet: https://item.szlcsc.com/datasheet/0603WAF4701T5E/23889.html; Supplier: LCSC; Type: 厚膜电阻; Tolerance: ±1%; Power(Watts): 100mW; Voltage-Supply(Max): 75V; Temperature Coefficient: ±100ppm/℃; Operating Temperature: -55℃~+155℃
R16 R17 = 0603WAF1104T5E: 电阻类型:厚膜电阻;阻值:1.1MΩ;精度:±1%;功率:100mW;工作电压:75V;温度系数:±100ppm/℃;; LCSC Part Name: 厚膜电阻 1.1MΩ ±1%; Supplier Part: C13314; Manufacturer: UNI-ROYAL(厚声); Supplier Footprint: 0603; JLCPCB Part Class: Extended Part; Datasheet: https://item.szlcsc.com/datasheet/0603WAF1104T5E/13961.html; Supplier: LCSC; Type: 厚膜电阻; Tolerance: ±1%; Power(Watts): 100mW; Voltage-Supply(Max): 75V; Temperature Coefficient: ±100ppm/℃; Operating Temperature: -55℃~+155℃
R47 = RE0805FAR000: 电阻类型:合金电阻;阻值:0Ω;精度:±1%;功率:500mW;温度系数:±50ppm/℃;安装方式:贴片;; LCSC Part Name: 0Ω ±1% 125mW 厚膜电阻; Supplier Part: C17477; Manufacturer: UNI-ROYAL(厚声); Manufacturer Part: 0805W8F0000T5E; Supplier Footprint: 0805; JLCPCB Part Class: Basic Part; Datasheet: https://item.szlcsc.com/datasheet/0805W8F0000T5E/18165.html; Supplier: LCSC; Type: 厚膜电阻; Tolerance: ±1%; Power(Watts): 125mW; Temperature Coefficient: ±800ppm/℃; Mounting Type: 贴片; Voltage-Supply(Max): 150V; Operating Temperature: -55℃~+155℃
R48 R49 R51 = 0603WAF1003T5E: 电阻类型:厚膜电阻;阻值:100kΩ;精度:±1%;功率:100mW;工作电压:75V;温度系数:±100ppm/℃;; LCSC Part Name: 厚膜电阻 100kΩ ±1%; Supplier Part: C25803; Manufacturer: UNI-ROYAL(厚声); Supplier Footprint: 0603; JLCPCB Part Class: Basic Part; Datasheet: https://item.szlcsc.com/datasheet/0603WAF1003T5E/26546.html; Supplier: LCSC; Type: 厚膜电阻; Tolerance: ±1%; Power(Watts): 100mW; Voltage-Supply(Max): 75V; Temperature Coefficient: ±100ppm/℃; Operating Temperature: -55℃~+155℃
SW3 = MSK12C02: 电路结构:单刀双掷;安装方式:卧贴;开关颜色:-;额定电流:50mA;额定电压:12V;工作寿命:1万次;; LCSC Part Name: MSK12C02 白柄1.5编带; Supplier Part: C431540; Manufacturer: SHOU HAN(首韩); Supplier Footprint: SMD,8x2.8mm; JLCPCB Part Class: Extended Part; Datasheet: https://item.szlcsc.com/datasheet/MSK12C02/427897.html; Supplier: LCSC; Circuit: 单刀双掷; Termination Style: SMD接片; Length: 8mm; Width: 2.8mm; Switch Height: 1.4mm; Mounting Type: 卧贴; Current Rating: 50mA; Voltage Rating: 12V; Life: 1万次; Operating Temperature: -20℃~+70℃
U18 = AP2112K-3.3TRG1: 输出类型:固定;工作电压:6V;输出电压:3.3V;输出电流:600mA;电源纹波抑制比(PSRR):65dB@(1kHz);输出极性:正极;; LCSC Part Name: 输入6V 输出3.3V 600mA; Supplier Part: C51118; Manufacturer: DIODES(美台); Supplier Footprint: SOT-25-5; JLCPCB Part Class: Extended Part; Datasheet: https://item.szlcsc.com/datasheet/AP2112K-3.3TRG1/52131.html; Supplier: LCSC; Output Type: 固定; Voltage - Supply: 6V; Output Voltage: 3.3V; Output Current: 600mA; Power Supply Rejection Ratio (PSRR): 65dB@(1kHz); Voltage Dropout: 250mV@(600mA); standby current: 55uA; Noise: 50uVrms; Features: 带使能；过热保护；过流保护; Operating Temperature: -40℃~+85℃@(Ta); Output Configuration: 正极; Number of Outputs: 1
U19 = MCP73831T-2ACI/OT: 工作电压:3.75V~6V;最大充电电流:550mA;电池类型:锂电池;电池节数:1;; LCSC Part Name: 单节锂离子/锂聚合物充电管理控制器; Supplier Part: C424093; Manufacturer: MICROCHIP(美国微芯); Supplier Footprint: SOT-23-5; JLCPCB Part Class: Extended Part; Datasheet: https://item.szlcsc.com/datasheet/MCP73831T-2ACI%252FOT/417116.html; Supplier: LCSC; The Chip Type: 充电芯片; Voltage - Supply: 3.75V~6V; Charge Current - Max: 550mA; Charging Saturation Voltage: 4.2V; Type of Battery: 锂电池; Number of Cells: 1; Operating Temperature: -40℃~+85℃; Battery Temperature Detection: 不支持; Supply Current (Iq): 53uA
USB1 = TYPE-C 6P: 连接器类型:Type-C;协议标准:-;公母:母;安装方式:卧贴;触点数量:6P;端口数量:1;额定电流 - 电源:3A;工作温度:-40℃~+85℃;; LCSC Part Name: 6P卧贴母座; Supplier Part: C456012; Manufacturer: SHOU HAN(首韩); Supplier Footprint: SMD; JLCPCB Part Class: Extended Part; Datasheet: https://item.szlcsc.com/datasheet/TYPE-C%25206P/458819.html; Supplier: LCSC; Connector Type: Type-C; Gender: 母; Mounting Type: 卧贴; Number of Contacts: 6P; Number of Ports: 1; Current Rating-Power: 3A; Voltage Rating: 5V; Connect-Disconnect Life: 3千次; Detection color: 黑色; Operating Temperature: -40℃~+85℃

## Nets
DGND: C2.2 C3.2 C4.2 C5.2 C6.1 C7.1 C8.1 C9.2 C10.2 C11.2 C12.2 C20.1 C21.1 C22.1 C23.1 C24.1 C25.2 C26.1 C34.1 C35.1 C36.2 C69.1 J3.1 J3.5 J3.6 J4.1 J4.5 J4.6 J5.1 J5.5 J5.6 J6.1 J6.5 J6.6 J7.1 J7.5 J7.6 R17.1 R44.2 R47.2 R49.1 RF1.2 RST.1 TP1.1 TP5.1 U1.31(VSS) U1.45(VSS) U1.49(EP) U16.6(GND) U16.7(GND) U17.6(GND) U17.8(GND) X2.2(GND) X2.4(GND)
GND: C1.1 C28.1 C29.1 C30.1 C31.1 C66.1 CN4.1 CN4.3 CN4.4 J1.3 J1.4 J1.6 J1.8 J1.15 R2.1 R3.1 R12.1 R15.2 R47.1 SW3.1 TP23.1 U18.2(GND) U19.2(VSS) USB1.7(EH) USB1.A12(GND) USB1.B12(GND)
VBAT: C31.2 CN4.2 D5.2(A) Q3.3(D) R16.2 TP21.1 U19.3(VBAT)
VBUS: C1.2 D1.2(A) LED6.2(A) Q3.1(G) R12.2 R48.2 TP20.1 U19.4(VDD) USB1.A9(VBUS) USB1.B9(VBUS)
VBUS_DET: R48.1 R49.2 U1.40(P0.28/AIN4)
VDD: C2.1 C6.2 C8.2 C29.2 C30.2 J1.5 LED7.2(A) Q1.2(S) Q2.2(S) R1.2 R8.1 R35.1 RGB1.4(+B) RGB1.5(+R) RGB1.6(+G) TP4.1 U1.13(VDD) U1.36(VDD) U1.48(VDD) U18.5(VOUT)
VDD_EXT: C21.2 J3.2 J4.2 J5.2 J6.2 J7.2 Q2.3(D)
VDD_MAIN: C20.2 C23.2 C25.1 C26.2 Q1.3(D) R9.2 R10.2 U16.1(SDO/SA0) U16.2(SDx) U16.3(SCx) U16.5(VDDIO) U16.8(VDD) U16.12(CS) U17.3(CS) U17.9(Vdd) U17.10(Vdd_IO)
32KI: C9.1 U1.2(P0.00/XL1) X1.1(OSC1)
32KO: C10.1 U1.3(P0.01/XL2) X1.2(OSC2)
BAT_AD: C69.2 R16.1 R17.2 U1.43(P0.31/AIN7)
EN_VDD_EXT: Q2.1(G) R8.2 U1.29(P0.24)
EN_VDD_MAIN: Q1.1(G) R35.2 U1.28(P0.23)
NNC_INT: J1.12 U1.8(P0.06)
NNC_NRST: J1.13 U1.9(P0.07)
PWR_SW_G: Q5.1(G) R51.2 SW3.2
RESET: C3.1 R1.1 RST.2 U1.24(P0.21/RESET)
RGB_B: R54.1 U1.37(P0.25)
RGB_G: R53.1 U1.38(P0.26)
RGB_R: R52.1 U1.39(P0.27)
SCL0: R10.1 U1.19(P0.16/TRACE1) U16.13(SCL) U17.1(SCL/SPC)
SCL1: J7.4 U1.14(P0.11)
SCL2: J6.4 U1.20(P0.17)
SCL3: J5.4 U1.12(P0.10/NFC2)
SCL4: J3.4 U1.23(P0.20/TRACECLK)
SCL5: J4.4 U1.17(P0.14/TRACE3)
SDA0: R9.1 U1.18(P0.15/TRACE2) U16.14(SDA) U17.4(SDA/SDI/SDO)
SDA1: J7.3 U1.15(P0.12)
SDA2: J6.3 U1.21(P0.18/TRACEDATA[0]/SWO)
SDA3: J5.3 U1.11(P0.09/NFC1)
SDA4: J3.3 U1.22(P0.19)
SDA5: J4.3 U1.16(P0.13)
SPI_CLK: J1.7 U1.4(P0.02/AIN0)
SPI_CS: J1.11 U1.7(P0.05/AIN3)
SPI_MISO: J1.10 U1.6(P0.04/AIN2)
SPI_MOSI: J1.9 U1.5(P0.03/AIN1)
STIM_EN_N: J1.14 U1.10(P0.08)
SWCLK: TP2.1 U1.25(SWDCLK)
SWDIO: TP3.1 U1.26(SWDIO)
UART_RX: TP7.1 U1.42(P0.30/AIN6)
UART_TX: TP6.1 U1.41(P0.29/AIN5)
VOUT: C66.2 J1.1 J1.2 Q5.3(D) R13.2 TP22.1 U18.1(VIN)
VOUT_IN: C28.2 D1.1(K) D5.1(K) Q3.2(S) Q5.2(S) R51.1
XTAL32MI: C12.1 U1.35(XC2) X2.3
XTAL32MO: C11.1 U1.34(XC1) X2.1
$1N12: C24.2 U1.1(DEC1)
$1N36: C5.1 U1.33(DEC3)
$1N356: C34.2 L3.1 U1.30(ANT)
$1N378: L2.1 U1.47(DCC)
$1N379: L2.2 L4.1
$1N451: LED7.1(K) R44.1
$1N467: C7.2 L4.2 U1.46(DEC4)
$1N506: R52.2 RGB1.2(-R)
$1N508: R53.2 RGB1.3(-G)
$1N510: R54.2 RGB1.1(-B)
$3N5: R13.1 U18.3(EN)
$3N23: LED6.1(K) R14.2
$3N28: R15.1 U19.5(PROG)
$3N31: R14.1 U19.1(STAT)
$3N61: R2.2 USB1.B5(CC2)
$3N62: R3.2 USB1.A5(CC1)
$4N4: C22.2 U17.5(C1)
Net-(C4-1): C4.1 U1.32(DEC2)
Net-(C35-2): C35.2 C36.1 L3.2 RF1.1

Not connected (* = marked no-connect by the designer): J1 16*; SCREW3 1; SCREW4 1; SW3 3* 4*; U1 27(P0.22) 44(NC)*; U16 4(INT1)* 9(INT2)* 10(NC)* 11(NC)*; U17 2(NC)* 7(INT/DRDY/SDO)* 11(NC)* 12(NC)*; U18 4(NC)*

## Notes on the sheets
sheet 1
- 调试接口
- 外部低速晶振
- 串口
- 外部高速晶振
- 主控芯片
- 指示灯
sheet 2
- AP2112K-3.3TRG1
- TYPE-C输入
- 系统开关
- VDDLDO
- 电池充电
- 电池电量检测
- 电池插座
- VBUS检测
- 0Ω接地
- 外部电源控制
sheet 3
- 腕部IMU
- 腕部磁力计
- 板间接口
- 连接手指
